# Altium schematic sheet Sheet2.SchDoc
size A
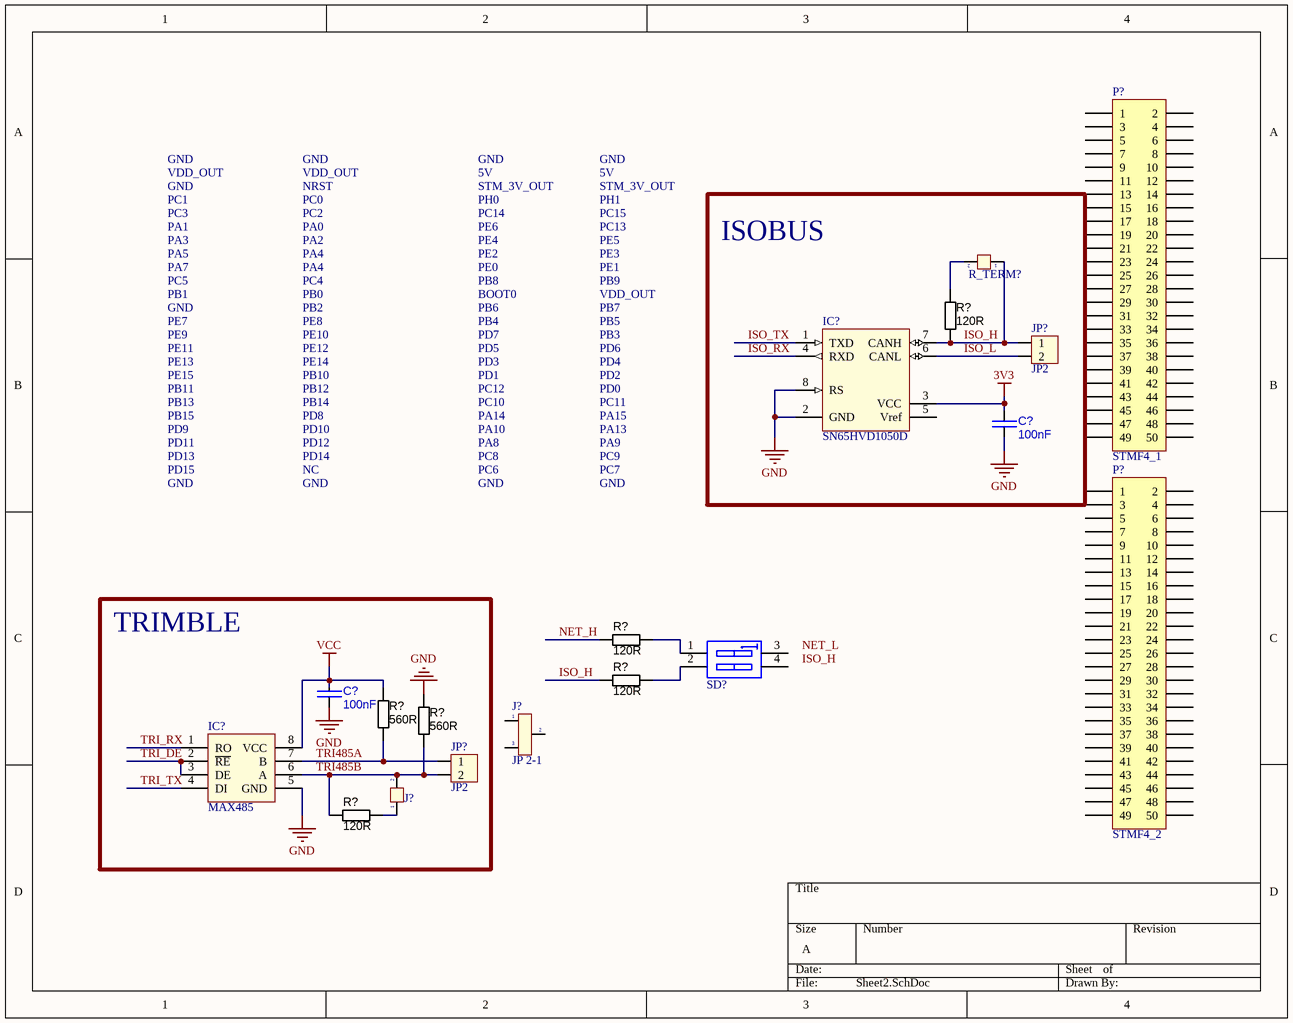
[diagram p0: Sheet2.SchDoc]

## Parts
(Parts that share a designator on the sheet are numbered #1, #2 ... from top to bottom, then left to right.)
C?#1  value 100nF  [CAPC2012X135N]  (hidden comment: approved sub OK)
C?#2  value 100nF  [CAPC2012X135N]  (hidden comment: approved sub OK)
IC?#1  SN65HVD1050D  [SO-8N]
IC?#2  MAX485  [DIP8/W0.3]
J?#1  JP 2-1  [JP3]
J?#2  Jumper 2  [JP2]  (value not drawn)
JP?#1  JP2  [CON2]
JP?#2  JP2  [CON2]
P?#1  STMF4_1  [HDR2X25H]
P?#2  STMF4_2  [HDR2X25H]
R?#1  value 120R  [RESC2012N_ZERO]  (hidden comment: Jumper)
R?#2  value 120R  [RESC2012N_ZERO]  (hidden comment: Jumper)
R?#3  value 120R  [RESC2012N_ZERO]  (hidden comment: Jumper)
R?#4  value 560R  [RESC2012N_ZERO]  (hidden comment: Jumper)
R?#5  value 560R  [RESC2012N_ZERO]  (hidden comment: Jumper)
R?#6  value 120R  [RESC2012N_ZERO]  (hidden comment: Jumper)
R_TERM?  Jumper 2  [JP2]  (value not drawn)
SD?  SW - DIP2  [DIP4/W0.3K]  (value not drawn)

## Blocks framed on the sheet
ISOBUS: C?#1 IC?#1 JP?#1 R?#1 R_TERM?
TRIMBLE: C?#2 IC?#2 J?#2 JP?#2 R?#4-R?#6

## Nets
3V3: C?#1.2 IC?#1.3(VCC)
GND: C?#1.1 C?#2.1 IC?#1.2(GND) IC?#1.8(RS) IC?#2.5(GND) R?#5.2
VCC: C?#2.2 IC?#2.8(VCC) R?#4.2
ISO_H: IC?#1.7(CANH) JP?#1.1 R?#1.1 R?#3.2 R_TERM?.1
ISO_L: IC?#1.6(CANL) JP?#1.2
ISO_RX: IC?#1.4(RXD)
ISO_TX: IC?#1.1(TXD)
NET_H: R?#2.2
TRI485A: IC?#2.7(B) JP?#2.1 R?#4.1
TRI485B: IC?#2.6(A) J?#2.2 JP?#2.2 R?#5.1 R?#6.1
TRI_DE: IC?#2.2(~{RE}) IC?#2.3(DE)
TRI_RX: IC?#2.1(RO)
TRI_TX: IC?#2.4(DI)
NetJ?#2_1: J?#2.1 R?#6.2
NetR?#1_2: R?#1.2 R_TERM?.2
NetR?#2_1: R?#2.1 SD?.1(A1)
NetR?#3_1: R?#3.1 SD?.2(A2)

Not connected (* = marked no-connect by the designer): IC?#1 5(Vref); J?#1 1 2 3; P?#1 1 2 3 4 5 6 7 8 9 10 11 12 13 14 15 16 17 18 19 20 21 22 23 24 25 26 27 28 29 30 31 32 33 34 35 36 37 38 39 40 41 42 43 44 45 46 47 48 49 50; P?#2 1 2 3 4 5 6 7 8 9 10 11 12 13 14 15 16 17 18 19 20 21 22 23 24 25 26 27 28 29 30 31 32 33 34 35 36 37 38 39 40 41 42 43 44 45 46 47 48 49 50; SD? 3(A3) 4(A4)

## Notes on the sheet
- GND
- VDD_OUT
- PC1
- PC3
- PA1
- NRST
- PC0
- PC2
- PA0
- 5V
- STM_3V_OUT
- PH0
- PC14
- PE6
- PH1
- PC15
- PC13
- PA3
- PA5
- PA7
- PC5
- PB1
- PA2
- PA4
- PC4
- PB0
- PE4
- PE2
- PE0
- PB8
- BOOT0
- PE5
- PE3
- PE1
- PB9
- PE7
- PE9
- PE11
- PE13
- PB2
- PE8
- PE10
- PE12
- PE14
- PB6
- PB4
- PD7
- PD5
- PD3
- PB7
- PB5
- PB3
- PD6
- PD4
- PE15
- PB11
- PB13
- PB15
- PD9
- PD8
- PD10
- PB10
- PB12
- PB14
- PD1
- PC12
- PC10
- PA14
- PA10
- PD2
- PD0
- PC11
- PA15
- PA13
- PD11
- PD13
- PD15
- PD12
- PD14
- NC
- PA8
- PC8
- PC6
- PA9
- PC9
- PC7
- Labels drawn without touching a wire or pin: ISO_H, NET_L

## Library data of the parts
C?#1 C?#2 = CAP C_0805: Capacitor SMD Cer 1.8nF 10% 50V X7R 0805; Manufacturer 1: AVX Corporation; Manufacturer Part Number 1: 08055C182KAT2A; Ratings: 50V; X7R; SCDType: source*; Tolerance: ±10%; Operating Temperature: -55°C ~ 125°C; Package / Case: 0805 (2012 metric); Supplier 1: Digi-Key; Supplier Part Number 1: 478-1374-1-ND
IC?#1 = SN65HVD1050D: CAN DRIVER
IC?#2 = MAX485: RS232 - RS485 (Same sn75176)
J?#1 = JP 2-1: Jumper 2-1; Value: J2-1
J?#2 R_TERM? = JP 2: Value: JP 2
JP?#1 JP?#2 = Con2: Connector 2; Value: Connector 2
P?#1 P?#2 = Header 25X2H: Header, 25-Pin, Dual row, Right Angle; LatestRevisionDate: 17-Jul-2002; LatestRevisionNote: Re-released for DXP Platform.; Publisher: Altium Limited
R?#1-R?#6 = RES_0805: Resistor SMD chip 0.0 Ohm 0.125W 0805; Manufacturer 1: Samsung Electro-Mechanics America, Inc; Manufacturer Part Number 1: RC2012J000CS; Ratings: 1/8W; SCDType: spec; Tolerance: N/A; Package / Case: 0805 (2012 metric); Supplier 1: Digi-Key; Supplier Part Number 1: 1276-5466-6-ND; RoHS 1: RoHS Compliant; ComponentLink1URL: http://www.samsungsem.com/servlet/FileDownload?filename=productcatalog/pdf/Chip_Resistor.pdf; ComponentLink1Description: http://www.samsungsem.com/servlet/FileDownload?filename=productcatalog/pdf/Chip_Resistor.pdf; Supplier 2: Digi-Key; Supplier Part Number 2: RMCF0805ZT0R00DKR-ND; Manufacturer 2: Stackpole Electronics Inc; Manufacturer Part Number 2: RMCF0805ZT0R00; RoHS 2: RoHS Compliant; ComponentLink2URL: http://www.seielect.com/Catalog/SEI-RMCF_RMCP.pdf; ComponentLink2Description: http://www.seielect.com/Catalog/SEI-RMCF_RMCP.pdf; Supplier 3: Digi-Key; Supplier Part Number 3: 311-0.0ARDKR-ND; Manufacturer 3: Yageo; Manufacturer Part Number 3: RC0805JR-070RL; RoHS 3: RoHS Compliant; ComponentLink3URL: http://media.digikey.com/pdf/Data%20Sheets/Yageo%20PDFs/RC0805%20Pb%20Free.pdf; ComponentLink3Description: http://media.digikey.com/pdf/Data%20Sheets/Yageo%20PDFs/RC0805%20Pb%20Free.pdf; Supplier 4: Digi-Key; Supplier Part Number 4: P0.0ADKR-ND; Manufacturer 4: Panasonic Electronic Components; Manufacturer Part Number 4: ERJ-6GEY0R00V; RoHS 4: RoHS Compliant; ComponentLink4URL: http://industrial.panasonic.com/www-cgi/jvcr13pz.cgi?E+PZ+3+AOA0001+ERJ6GEY0R00V+7+WW; ComponentLink4Description: http://industrial.panasonic.com/www-cgi/jvcr13pz.cgi?E+PZ+3+AOA0001+ERJ6GEY0R00V+7+WW; Supplier 5: Digi-Key; Supplier Part Number 5: RHM0.0CPDKR-ND; Manufacturer 5: Rohm Semiconductor; Manufacturer Part Number 5: MCR10ERTJ000; RoHS 5: RoHS Compliant; ComponentLink5URL: http://rohmfs.rohm.com/en/products/databook/datasheet/passive/resistor/chip_resistor/mcr_g.pdf; ComponentLink5Description: http://rohmfs.rohm.com/en/products/databook/datasheet/passive/resistor/chip_resistor/mcr_g.pdf
SD? = SWDIP-2: DIP Switch, 2 Position, SPST; Value: SW - DIP2